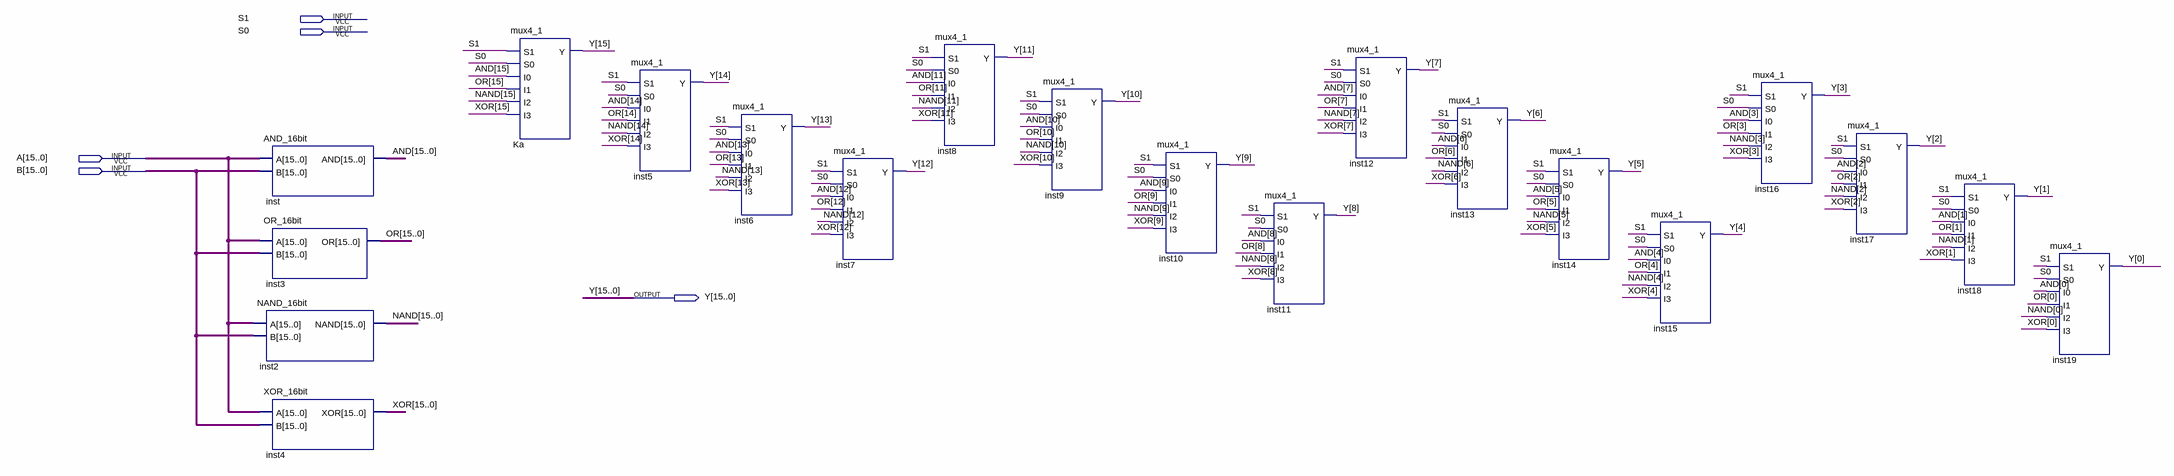
[diagram p0: schematic sheet]
// Quartus schematic LU.bdf as structural Verilog: 20 symbols, 5 pins
module LU (
  input  S1,
  input  S0,
  input  [15:0] A,
  input  [15:0] B,
  output [15:0] Y
);

  wire [15:0] AND, NAND, OR, XOR;

  NAND_16bit inst2 (.A(A), .B(B), .NAND(NAND));
  AND_16bit inst (.A(A), .B(B), .AND(AND));
  OR_16bit inst3 (.A(A), .B(B), .OR(OR));
  XOR_16bit inst4 (.A(A), .B(B), .XOR(XOR));
  mux4_1 Ka (.S1(S1), .S0(S0), .I0(AND[15]), .I1(OR[15]), .I2(NAND[15]), .I3(XOR[15]), .Y(Y[15]));
  mux4_1 inst5 (.S1(S1), .S0(S0), .I0(AND[14]), .I1(OR[14]), .I2(NAND[14]), .I3(XOR[14]), .Y(Y[14]));
  mux4_1 inst6 (.S1(S1), .S0(S0), .I0(AND[13]), .I1(OR[13]), .I2(NAND[13]), .I3(XOR[13]), .Y(Y[13]));
  mux4_1 inst7 (.S1(S1), .S0(S0), .I0(AND[12]), .I1(OR[12]), .I2(NAND[12]), .I3(XOR[12]), .Y(Y[12]));
  mux4_1 inst8 (.S1(S1), .S0(S0), .I0(AND[11]), .I1(OR[11]), .I2(NAND[11]), .I3(XOR[11]), .Y(Y[11]));
  mux4_1 inst9 (.S1(S1), .S0(S0), .I0(AND[10]), .I1(OR[10]), .I2(NAND[10]), .I3(XOR[10]), .Y(Y[10]));
  mux4_1 inst10 (.S1(S1), .S0(S0), .I0(AND[9]), .I1(OR[9]), .I2(NAND[9]), .I3(XOR[9]), .Y(Y[9]));
  mux4_1 inst11 (.S1(S1), .S0(S0), .I0(AND[8]), .I1(OR[8]), .I2(NAND[8]), .I3(XOR[8]), .Y(Y[8]));
  mux4_1 inst12 (.S1(S1), .S0(S0), .I0(AND[7]), .I1(OR[7]), .I2(NAND[7]), .I3(XOR[7]), .Y(Y[7]));
  mux4_1 inst13 (.S1(S1), .S0(S0), .I0(AND[6]), .I1(OR[6]), .I2(NAND[6]), .I3(XOR[6]), .Y(Y[6]));
  mux4_1 inst14 (.S1(S1), .S0(S0), .I0(AND[5]), .I1(OR[5]), .I2(NAND[5]), .I3(XOR[5]), .Y(Y[5]));
  mux4_1 inst15 (.S1(S1), .S0(S0), .I0(AND[4]), .I1(OR[4]), .I2(NAND[4]), .I3(XOR[4]), .Y(Y[4]));
  mux4_1 inst16 (.S1(S1), .S0(S0), .I0(AND[3]), .I1(OR[3]), .I2(NAND[3]), .I3(XOR[3]), .Y(Y[3]));
  mux4_1 inst17 (.S1(S1), .S0(S0), .I0(AND[2]), .I1(OR[2]), .I2(NAND[2]), .I3(XOR[2]), .Y(Y[2]));
  mux4_1 inst18 (.S1(S1), .S0(S0), .I0(AND[1]), .I1(OR[1]), .I2(NAND[1]), .I3(XOR[1]), .Y(Y[1]));
  mux4_1 inst19 (.S1(S1), .S0(S0), .I0(AND[0]), .I1(OR[0]), .I2(NAND[0]), .I3(XOR[0]), .Y(Y[0]));
endmodule
